# Altium project w550_module_dadesazan.PrjPcb
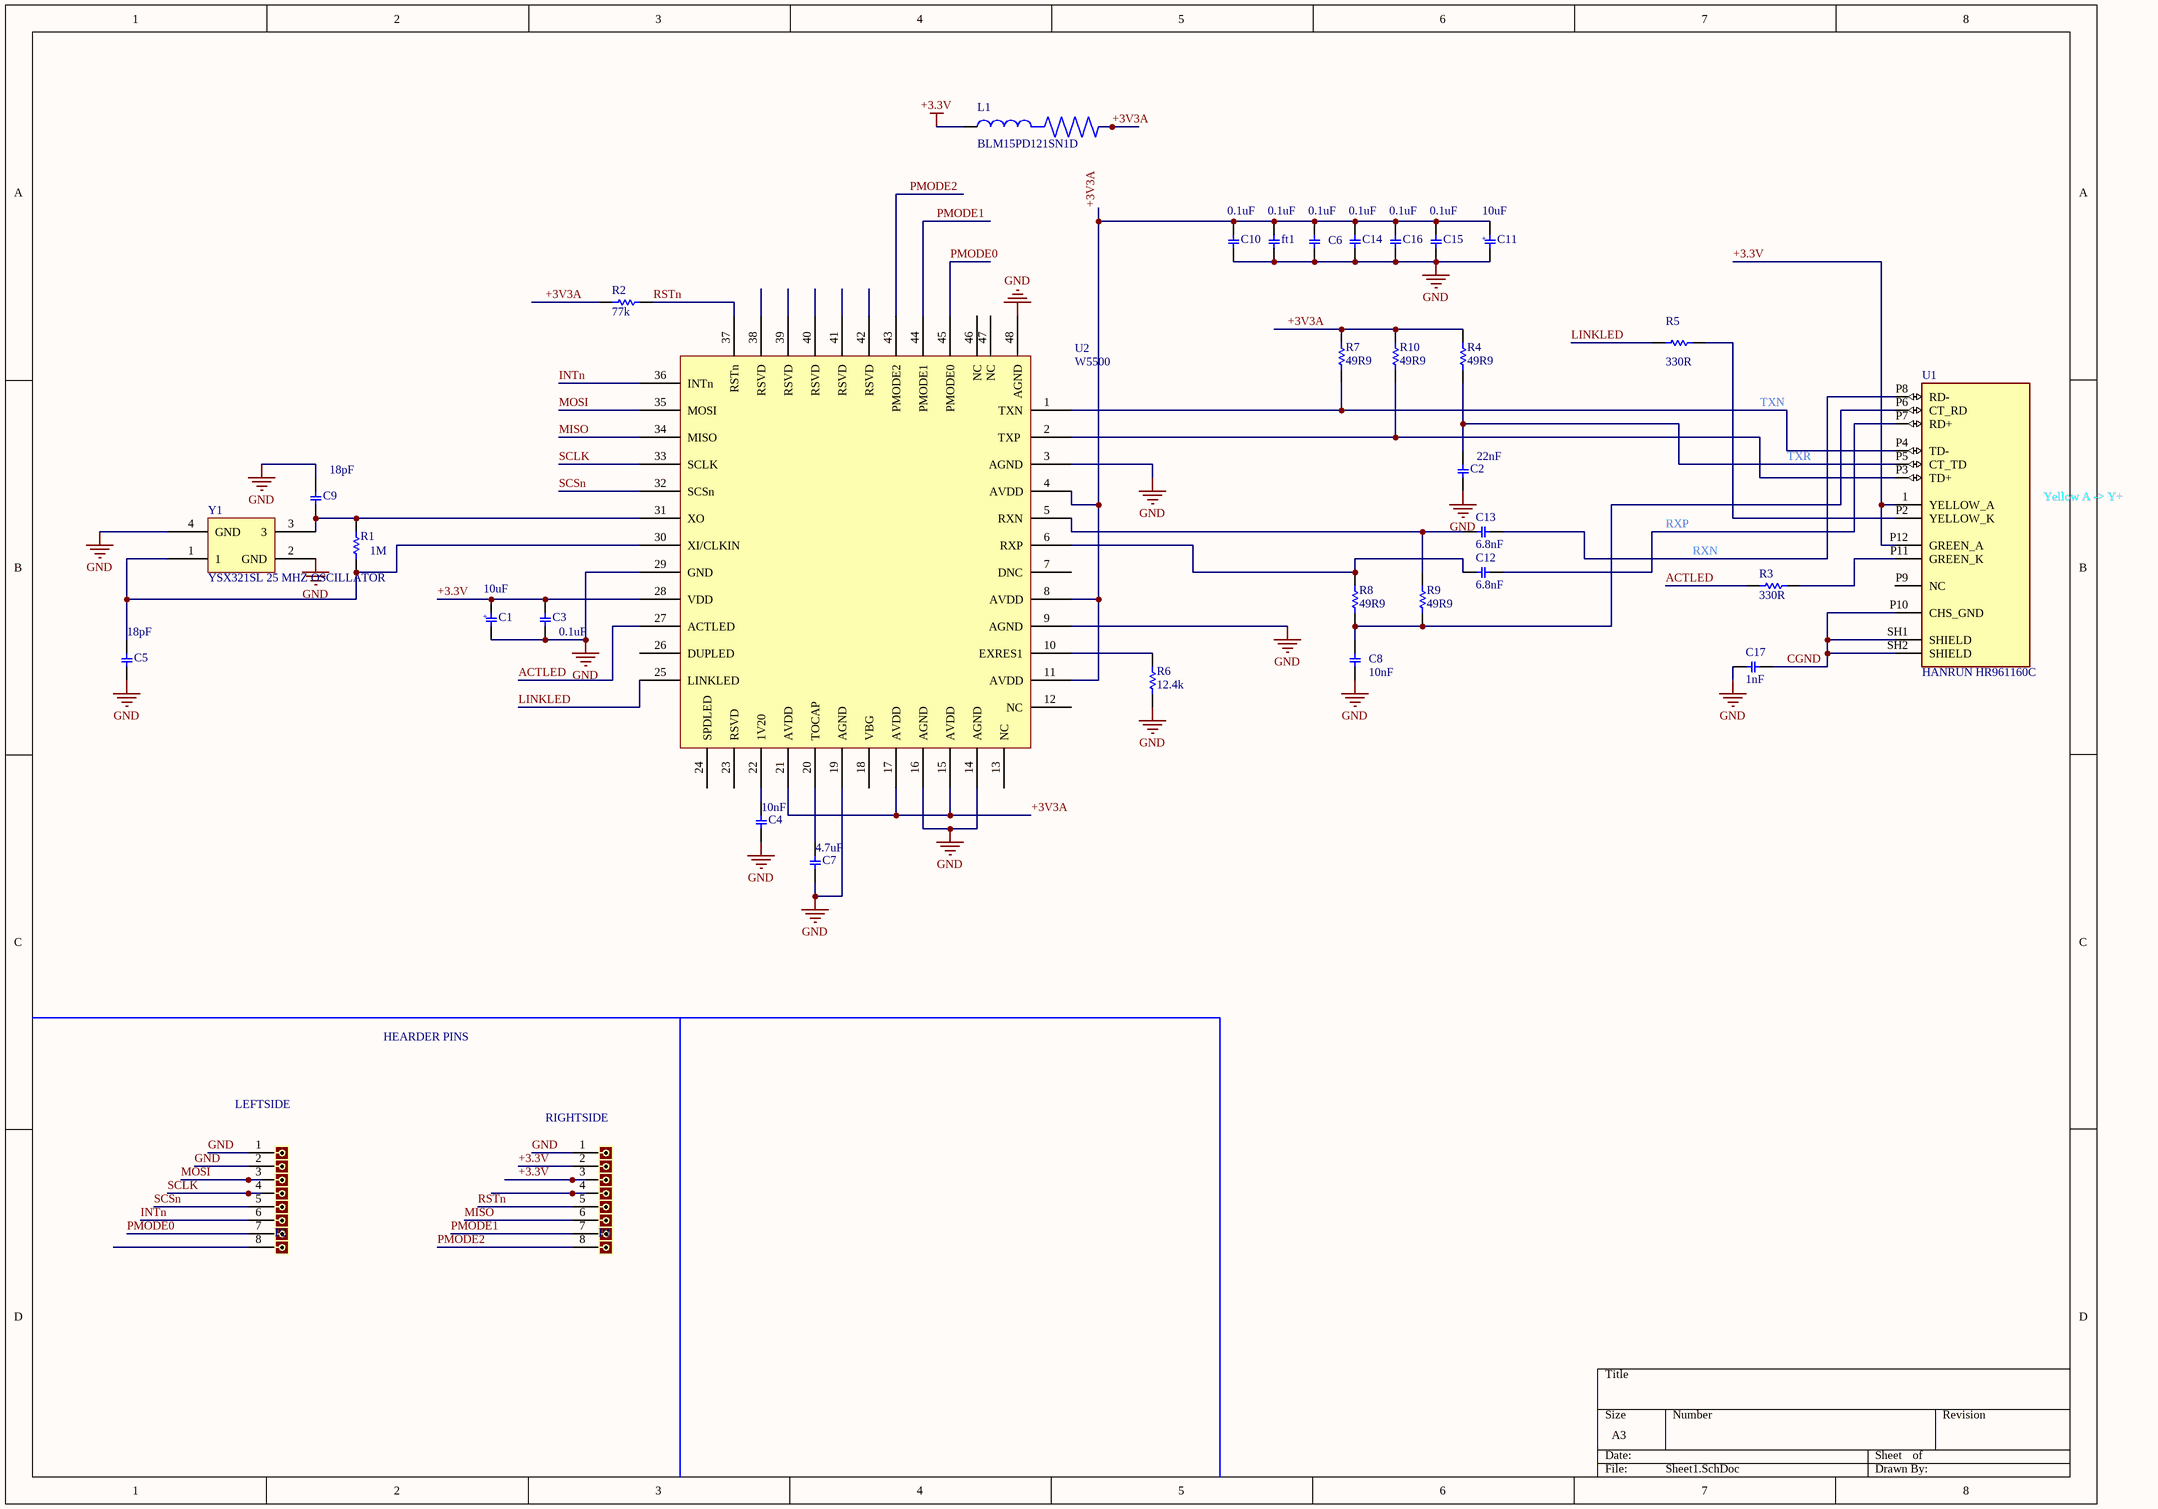
[diagram p0: Sheet1.SchDoc]
1 sheet, 34 parts. Net scope: global (net labels, ports and power ports of the same name join across sheets).
Board file: PCB1 (2).PcbDoc

## Sheet Sheet1.SchDoc
size A3; SheetNumber: 1; SheetTotal: 1

### Parts
C1  10uF  [CAPP 1206 (3216X18L) Size A]
C2  22nF  [C0603]
C3  0.1uF  [C0603]
C4  10nF  [C0603]
C5  18pF  [C0603]
C6  0.1uF  [C0402]
C7  4.7uF  [C0603]
C8  10nF  [C0603]
C9  18pF  [C0603]
C10  0.1uF  [C0402]
C11  10uF  [CAPP 1206 (3216X18L) Size A]
C12  6.8nF  [C0603]
C13  6.8nF  [C0603]
C14  0.1uF  [C0402]
C15  0.1uF  [C0402]
C16  0.1uF  [C0402]
C17  1nF  [C1206]
ft1  0.1uF  [C0402]
L1  BLM15PD121SN1D  [BLM15PD121SN1D]
P1  Male Header Single 08  [HDR 1X8]  (value not drawn)
P2  Male Header Single 08  [HDR 1X8]  (value not drawn)
R1  1M  [SMD-0603-RES]
R2  77k  [SMD-0603-RES]
R3  330R  [SMD-0603-RES]
R4  49R9  [SMD-0603-RES]
R5  330R  [SMD-0603-RES]
R6  12.4k  [SMD-0603-RES]
R7  49R9  [SMD-0603-RES]
R8  49R9  [SMD-0603-RES]
R9  49R9  [SMD-0603-RES]
R10  49R9  [SMD-0603-RES]
U1  HANRUN HR961160C  [HANRUN HR961160C]
U2  W5500  [W5500]
Y1  YSX321SL 25 MHZ OSCILLATOR  [YSX321SL]

### Nets
+3.3V: C1.2 C3.2 L1.1 P1.2 P1.3 U1.1(YELLOW_A) U1.P12(GREEN_A) U2.28(VDD)
GND: C1.1 C2.1 C3.1 C4.1 C5.1 C6.1 C7.1 C8.1 C9.1 C10.1 C11.1 C14.1 C15.1 C16.1 C17.1 ft1.1 P1.1 P2.1 P2.2 R6.2 U2.3(AGND) U2.9(AGND) U2.14(AGND) U2.16(AGND) U2.19(AGND) U2.29(GND) U2.48(AGND) Y1.2(GND) Y1.4(GND)
+3V3A: C6.2 C10.2 C11.2 C14.2 C15.2 C16.2 ft1.2 L1.2 R2.1 R4.2 R7.2 R10.2 U2.4(AVDD) U2.8(AVDD) U2.11(AVDD) U2.15(AVDD) U2.17(AVDD) U2.21(AVDD)
ACTLED: R3.1 U2.27(ACTLED)
CGND: C17.2 U1.P10(CHS_GND) U1.SH1(SHIELD) U1.SH2(SHIELD)
INTn: P2.6 U2.36(INTn)
LINKLED: R5.2 U2.25(LINKLED)
MISO: P1.6 U2.34(MISO)
MOSI: P2.3 U2.35(MOSI)
PMODE0: P2.7 U2.45(PMODE0)
PMODE1: P1.7 U2.44(PMODE1)
PMODE2: P1.8 U2.43(PMODE2)
RSTn: P1.5 R2.2 U2.37(RSTn)
SCLK: P2.4 U2.33(SCLK)
SCSn: P2.5 U2.32(SCSn)
NetC2_2: C2.2 R4.1 U1.P5(CT_TD)
NetC4_2: C4.2 U2.22(1V20)
NetC5_2: C5.2 R1.1 U2.30(XI/CLKIN) Y1.1
NetC7_2: C7.2 U2.20(TOCAP)
NetC8_2: C8.2 R8.1 R9.1 U1.P6(CT_RD)
NetC9_2: C9.2 R1.2 U2.31(XO) Y1.3
NetC12_1: C12.1 U1.P7(RD+)
NetC12_2: C12.2 R8.2 U2.6(RXP)
NetC13_1: C13.1 U1.P8(RD-)
NetC13_2: C13.2 R9.2 U2.5(RXN)
NetR3_2: R3.2 U1.P11(GREEN_K)
NetR5_1: R5.1 U1.P2(YELLOW_K)
NetR6_1: R6.1 U2.10(EXRES1)
NetR7_1: R7.1 U1.P4(TD-) U2.1(TXN)
NetR10_1: R10.1 U1.P3(TD+) U2.2(TXP)

Not connected (* = marked no-connect by the designer): P1 4; P2 8; U1 P9(NC); U2 7(DNC) 12(NC) 13(NC) 18(VBG) 23(RSVD) 24(SPDLED) 26(DUPLED) 38(RSVD) 39(RSVD) 40(RSVD) 41(RSVD) 42(RSVD) 46(NC) 47(NC)

### Notes on the sheet
- TXN
- TXR
- Yellow A -> Y+
- RXP
- RXN
- HEARDER PINS
- (near P2) LEFTSIDE
- (near P1) RIGHTSIDE
- (in symbol Capacitor Tantalum SMD) +

### Library data of the parts
C1 C11 = Capacitor Tantalum SMD: Value: 0; DatasheetVersion: 2022; ComponentLink1Description: Tarahiboard; ComponentLink1URL: https://www.tarahiboard.com
C2-C5 C7-C9 C12 C13 = Capacitor SMD 0603: Capacitor C SMD 0603; Value: 100nf; DatasheetVersion: 2022; ComponentLink1Description: Tarahiboard; ComponentLink1URL: https://www.tarahiboard.com
C6 C10 C14-C16 ft1 = Capacitor SMD 0402: Capacitor C SMD 0402; Value: 100nf; DatasheetVersion: 2022; ComponentLink1Description: Tarahiboard; ComponentLink1URL: https://www.tarahiboard.com
C17 = Capacitor SMD 1206: Capacitor C SMD 1206; Value: 100nf; DatasheetVersion: 2022; ComponentLink1Description: Tarahiboard; ComponentLink1URL: https://www.tarahiboard.com
P1 P2 = Male Header Single 08: Male, pitch: 2.54mm; ComponentLink1Description: Tarahiboard; ComponentLink1URL: https://www.tarahiboard.com/product/library-pack; DatasheetVersion: 2022
R1-R10 = Resistor SMD 0603: Value: 1K; DatasheetVersion: 2022; ComponentLink1Description: Website: Tarahiboard; ComponentLink1URL: https://www.tarahiboard.com/product/library-pack
Y1 = YSX321SL